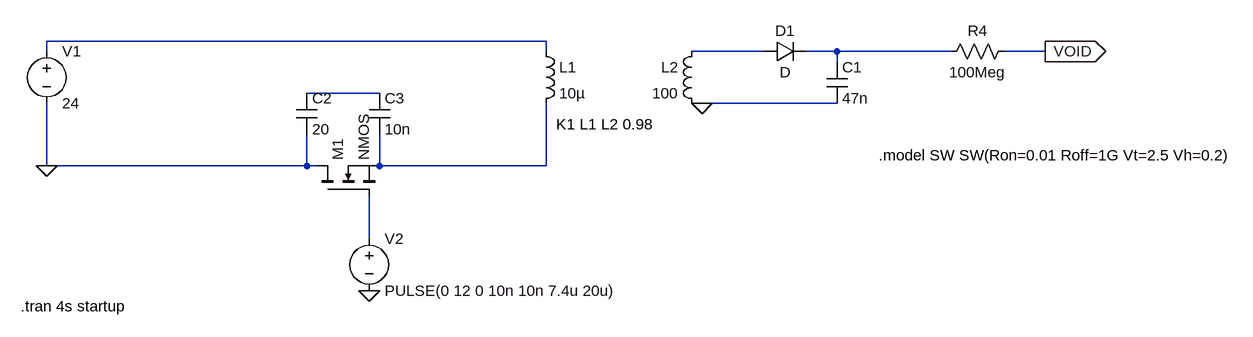
[diagram p0: schematic Draft1.asc]
Draft1.asc, the LTspice schematic file:
Version 4.1
SHEET 1 2344 680
WIRE 1056 80 288 80
WIRE 288 96 288 80
WIRE 1056 96 1056 80
WIRE 1392 96 1280 96
WIRE 1504 96 1456 96
WIRE 1680 96 1504 96
WIRE 1824 96 1760 96
WIRE 1504 112 1504 96
WIRE 800 160 688 160
WIRE 1296 176 1280 176
WIRE 1504 176 1296 176
WIRE 288 272 288 176
WIRE 688 272 688 224
WIRE 688 272 288 272
WIRE 704 272 688 272
WIRE 800 272 800 224
WIRE 1056 272 1056 176
WIRE 1056 272 800 272
WIRE 784 384 784 320
FLAG 784 464 0
FLAG 288 272 0
FLAG 1296 176 0
FLAG 1824 96 VOID
IOPIN 1824 96 Out
SYMBOL voltage 288 80 R0
SYMATTR InstName V1
SYMATTR Value 24
SYMBOL ind 1040 80 R0
SYMATTR InstName L1
SYMATTR Value 10µ
SYMATTR Type ind
SYMATTR SpiceLine Rser=1m
SYMBOL ind 1296 80 M0
SYMATTR InstName L2
SYMATTR Value 100
SYMATTR Type ind
SYMATTR SpiceLine Rser=1m
SYMBOL nmos 704 320 R270
SYMATTR InstName M1
SYMBOL voltage 784 368 R0
SYMATTR InstName V2
SYMATTR Value PULSE(0 12 0 10n 10n 7.4u 20u)
SYMBOL diode 1392 112 R270
WINDOW 0 32 32 VTop 2
WINDOW 3 0 32 VBottom 2
SYMATTR InstName D1
SYMBOL cap 1488 112 R0
SYMATTR InstName C1
SYMATTR Value 47n
SYMBOL cap 672 160 R0
SYMATTR InstName C2
SYMATTR Value 20
SYMBOL cap 784 160 R0
SYMATTR InstName C3
SYMATTR Value 10n
SYMBOL res 1664 112 R270
WINDOW 0 32 56 VTop 2
WINDOW 3 0 56 VBottom 2
SYMATTR InstName R4
SYMATTR Value 100Meg
TEXT 1072 208 Left 2 !K1 L1 L2 0.98
TEXT 248 488 Left 2 !.tran 4s startup
TEXT 1568 256 Left 2 !.model SW SW(Ron=0.01 Roff=1G Vt=2.5 Vh=0.2)

The netlist it stands for:
* Draft1.asc
V1 N001 0 24
L1 N001 N005 10µ Rser=1m
L2 N002 0 100 Rser=1m
M1 0 N006 N005 N005 NMOS
V2 N006 0 PULSE(0 12 0 10n 10n 7.4u 20u)
D1 N002 N003 D
C1 N003 0 47n
C2 N004 0 20
C3 N004 N005 10n
R4 N003 VOID 100Meg
.model D D
.lib standard.dio
.model NMOS NMOS
.model PMOS PMOS
.lib standard.mos
K1 L1 L2 0.98
.tran 4s startup
.model SW SW(Ron=0.01 Roff=1G Vt=2.5 Vh=0.2)
.backanno
.end